# Altium project OPB733TR Sensor Board.PrjPcb
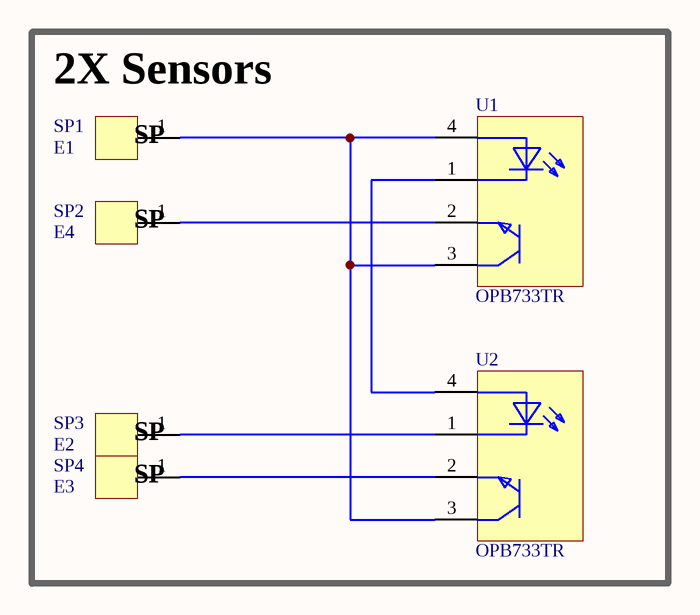
[diagram p0: 2x Sensor.SchDoc]
gDocumentNumber: 9268; gRevision: A; gTitle: Schematic, RR Sensor Board
1 sheet, 6 parts. Net scope: global (net labels, ports and power ports of the same name join across sheets).
Board file: PCB.PcbDoc

## Sheet 2x Sensor.SchDoc
size A4

### Parts
SP1  E1  [SP_1x1mm]
SP2  E4  [SP_1x1mm]
SP3  E2  [SP_1x1mm]
SP4  E3  [SP_1x1mm]
U1  OPB733TR  [OPTO-SMD_OPB733TR]
U2  OPB733TR  [OPTO-SMD_OPB733TR]

### Blocks framed on the sheet
2X Sensors: SP1-SP4 U1 U2

### Nets
NetSP1_1: SP1.1 U1.3(C) U1.4(A) U2.3(C)
NetSP2_1: SP2.1 U1.2(E)
NetSP3_1: SP3.1 U2.1(C)
NetSP4_1: SP4.1 U2.2(E)
NetU1_1: U1.1(C) U2.4(A)

### Notes on the sheet
- (in symbol SP_1X1) SP

### Library data of the parts
SP1-SP4 = SP_1X1: Manufacturer Part Number: NILL
U1 U2 = OPB733TR: Manufacturer Part Number: OPB733TR